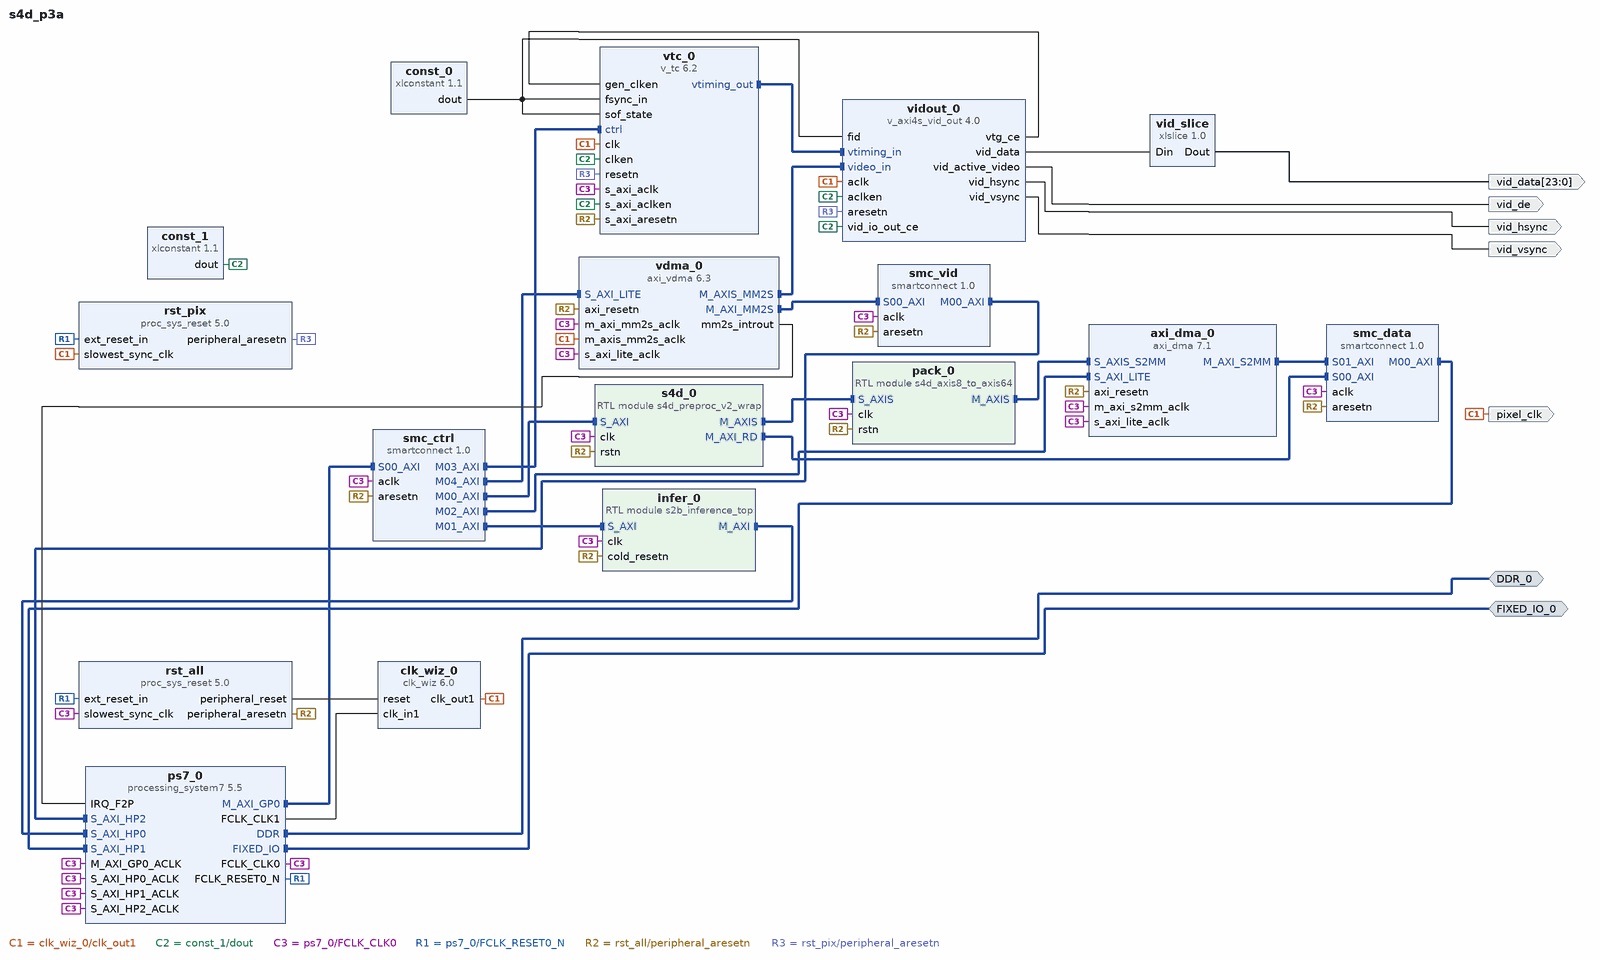
[diagram p0: block diagram of the top level]
# Vivado block design s4d_p3a, xc7z020clg400-2, Vivado 2026.1
create_bd_design s4d_p3a

create_bd_intf_port -mode Master -vlnv xilinx.com:interface:ddrx_rtl:1.0 DDR_0
create_bd_intf_port -mode Master -vlnv xilinx.com:display_processing_system7:fixedio_rtl:1.0 FIXED_IO_0
create_bd_port -dir O -type clk pixel_clk
create_bd_port -dir O vid_hsync
create_bd_port -dir O vid_vsync
create_bd_port -dir O vid_de
create_bd_port -dir O -from 23 -to 0 vid_data

create_bd_cell -type ip -vlnv xilinx.com:ip:processing_system7:5.5 ps7_0
set_property -dict [list \
  CONFIG.PCW_EN_CLK1_PORT 1 \
  CONFIG.PCW_FCLK_CLK1_BUF TRUE \
  CONFIG.PCW_FPGA0_PERIPHERAL_FREQMHZ 50 \
  CONFIG.PCW_FPGA1_PERIPHERAL_FREQMHZ 100 \
  CONFIG.PCW_FPGA_FCLK1_ENABLE 1 \
  CONFIG.PCW_IRQ_F2P_INTR 1 \
  CONFIG.PCW_USE_FABRIC_INTERRUPT 1 \
  CONFIG.PCW_USE_S_AXI_HP0 1 \
  CONFIG.PCW_USE_S_AXI_HP1 1 \
  CONFIG.PCW_USE_S_AXI_HP2 1 \
] [get_bd_cells ps7_0]
# 37 more settings of ps7_0 are not shown: defaults, MIO pin electricals, DDR timing, and values the tool derives
create_bd_cell -type module -reference s4d_preproc_v2_wrap s4d_0
set_property -dict {CONFIG.SRC_BASE 0x12000000} [get_bd_cells s4d_0]
create_bd_cell -type module -reference s2b_inference_top infer_0
set_property -dict {CONFIG.PROFILE_VISIBILITY_PROVEN 1} [get_bd_cells infer_0]
create_bd_cell -type module -reference s4d_axis8_to_axis64 pack_0
create_bd_cell -type ip -vlnv xilinx.com:ip:axi_dma:7.1 axi_dma_0
set_property -dict [list \
  CONFIG.c_addr_width 32 \
  CONFIG.c_include_mm2s 0 \
  CONFIG.c_include_s2mm 1 \
  CONFIG.c_include_sg 0 \
  CONFIG.c_m_axi_s2mm_data_width 64 \
  CONFIG.c_s_axis_s2mm_tdata_width 64 \
  CONFIG.c_sg_length_width 23 \
] [get_bd_cells axi_dma_0]
create_bd_cell -type ip -vlnv xilinx.com:ip:clk_wiz:6.0 clk_wiz_0
set_property -dict [list \
  CONFIG.CLKOUT1_DRIVES BUFG \
  CONFIG.CLKOUT1_REQUESTED_OUT_FREQ 74.25 \
  CONFIG.CLKOUT1_USED true \
  CONFIG.CLKOUT2_DRIVES BUFG \
  CONFIG.CLKOUT2_REQUESTED_OUT_FREQ 371.25 \
  CONFIG.CLKOUT2_USED true \
  CONFIG.MMCM_CLKFBOUT_MULT_F 59.375 \
  CONFIG.MMCM_CLKIN1_PERIOD 10.000 \
  CONFIG.MMCM_CLKOUT0_DIVIDE_F 10.000 \
  CONFIG.MMCM_CLKOUT1_DIVIDE 2 \
  CONFIG.MMCM_DIVCLK_DIVIDE 8 \
  CONFIG.NUM_OUT_CLKS 2 \
  CONFIG.OVERRIDE_MMCM true \
  CONFIG.PRIM_IN_FREQ 100.000 \
  CONFIG.PRIM_SOURCE Single_ended_clock_capable_pin \
  CONFIG.USE_LOCKED true \
  CONFIG.USE_RESET true \
] [get_bd_cells clk_wiz_0]
create_bd_cell -type ip -vlnv xilinx.com:ip:v_tc:6.2 vtc_0
set_property -dict [list \
  CONFIG.GEN_AVIDEO_POLARITY High \
  CONFIG.GEN_HBLANK_POLARITY High \
  CONFIG.GEN_HSYNC_POLARITY High \
  CONFIG.GEN_VBLANK_POLARITY High \
  CONFIG.GEN_VIDEO_FORMAT RGB \
  CONFIG.GEN_VSYNC_POLARITY High \
  CONFIG.HAS_AXI4_LITE true \
  CONFIG.HAS_INTC_IF false \
  CONFIG.VIDEO_MODE 720p \
  CONFIG.enable_detection false \
  CONFIG.enable_generation true \
  CONFIG.max_clocks_per_line 4096 \
  CONFIG.max_lines_per_frame 4096 \
] [get_bd_cells vtc_0]
create_bd_cell -type ip -vlnv xilinx.com:ip:axi_vdma:6.3 vdma_0
set_property -dict [list \
  CONFIG.c_addr_width 32 \
  CONFIG.c_include_mm2s 1 \
  CONFIG.c_include_s2mm 0 \
  CONFIG.c_include_sg 0 \
  CONFIG.c_m_axi_mm2s_data_width 64 \
  CONFIG.c_m_axis_mm2s_tdata_width 32 \
  CONFIG.c_use_fsync 0 \
] [get_bd_cells vdma_0]
create_bd_cell -type ip -vlnv xilinx.com:ip:v_axi4s_vid_out:4.0 vidout_0
set_property -dict [list \
  CONFIG.C_ADDR_WIDTH 10 \
  CONFIG.C_HAS_ASYNC_CLK 0 \
  CONFIG.C_HYSTERESIS_LEVEL 12 \
  CONFIG.C_NATIVE_COMPONENT_WIDTH 8 \
  CONFIG.C_PIXELS_PER_CLOCK 1 \
  CONFIG.C_S_AXIS_VIDEO_DATA_WIDTH 8 \
  CONFIG.C_S_AXIS_VIDEO_FORMAT 6 \
  CONFIG.C_VTG_MASTER_SLAVE 0 \
] [get_bd_cells vidout_0]
create_bd_cell -type ip -vlnv xilinx.com:ip:xlslice:1.0 vid_slice
set_property -dict {CONFIG.DIN_FROM 23 CONFIG.DIN_TO 0 CONFIG.DIN_WIDTH 32 CONFIG.DOUT_WIDTH 24} [get_bd_cells vid_slice]
create_bd_cell -type ip -vlnv xilinx.com:ip:proc_sys_reset:5.0 rst_all
create_bd_cell -type ip -vlnv xilinx.com:ip:proc_sys_reset:5.0 rst_pix
create_bd_cell -type ip -vlnv xilinx.com:ip:xlconstant:1.1 const_1
set_property -dict {CONFIG.CONST_VAL 1 CONFIG.CONST_WIDTH 1} [get_bd_cells const_1]
create_bd_cell -type ip -vlnv xilinx.com:ip:xlconstant:1.1 const_0
set_property -dict {CONFIG.CONST_VAL 0 CONFIG.CONST_WIDTH 1} [get_bd_cells const_0]
create_bd_cell -type ip -vlnv xilinx.com:ip:smartconnect:1.0 smc_ctrl
set_property -dict {CONFIG.NUM_MI 5 CONFIG.NUM_SI 1} [get_bd_cells smc_ctrl]
create_bd_cell -type ip -vlnv xilinx.com:ip:smartconnect:1.0 smc_data
set_property -dict {CONFIG.NUM_MI 1 CONFIG.NUM_SI 2} [get_bd_cells smc_data]
create_bd_cell -type ip -vlnv xilinx.com:ip:smartconnect:1.0 smc_vid
set_property -dict {CONFIG.NUM_MI 1 CONFIG.NUM_SI 1} [get_bd_cells smc_vid]

# ---- connections ----

connect_bd_intf_net [get_bd_intf_pins axi_dma_0/M_AXI_S2MM] [get_bd_intf_pins smc_data/S01_AXI]
connect_bd_intf_net [get_bd_intf_pins infer_0/M_AXI] [get_bd_intf_pins ps7_0/S_AXI_HP0]
connect_bd_intf_net [get_bd_intf_pins pack_0/M_AXIS] [get_bd_intf_pins axi_dma_0/S_AXIS_S2MM]
connect_bd_intf_net [get_bd_intf_ports DDR_0] [get_bd_intf_pins ps7_0/DDR]
connect_bd_intf_net [get_bd_intf_ports FIXED_IO_0] [get_bd_intf_pins ps7_0/FIXED_IO]
connect_bd_intf_net [get_bd_intf_pins ps7_0/M_AXI_GP0] [get_bd_intf_pins smc_ctrl/S00_AXI]
connect_bd_intf_net [get_bd_intf_pins s4d_0/M_AXIS] [get_bd_intf_pins pack_0/S_AXIS]
connect_bd_intf_net [get_bd_intf_pins s4d_0/M_AXI_RD] [get_bd_intf_pins smc_data/S00_AXI]
connect_bd_intf_net [get_bd_intf_pins smc_ctrl/M00_AXI] [get_bd_intf_pins s4d_0/S_AXI]
connect_bd_intf_net [get_bd_intf_pins smc_ctrl/M01_AXI] [get_bd_intf_pins infer_0/S_AXI]
connect_bd_intf_net [get_bd_intf_pins smc_ctrl/M02_AXI] [get_bd_intf_pins axi_dma_0/S_AXI_LITE]
connect_bd_intf_net [get_bd_intf_pins smc_ctrl/M03_AXI] [get_bd_intf_pins vtc_0/ctrl]
connect_bd_intf_net [get_bd_intf_pins smc_ctrl/M04_AXI] [get_bd_intf_pins vdma_0/S_AXI_LITE]
connect_bd_intf_net [get_bd_intf_pins smc_data/M00_AXI] [get_bd_intf_pins ps7_0/S_AXI_HP1]
connect_bd_intf_net [get_bd_intf_pins smc_vid/M00_AXI] [get_bd_intf_pins ps7_0/S_AXI_HP2]
connect_bd_intf_net [get_bd_intf_pins vdma_0/M_AXIS_MM2S] [get_bd_intf_pins vidout_0/video_in]
connect_bd_intf_net [get_bd_intf_pins vdma_0/M_AXI_MM2S] [get_bd_intf_pins smc_vid/S00_AXI]
connect_bd_intf_net [get_bd_intf_pins vtc_0/vtiming_out] [get_bd_intf_pins vidout_0/vtiming_in]
connect_bd_net [get_bd_pins clk_wiz_0/clk_out1] \
  [get_bd_pins rst_pix/slowest_sync_clk] [get_bd_pins vtc_0/clk] [get_bd_pins vidout_0/aclk] \
  [get_bd_pins vdma_0/m_axis_mm2s_aclk] [get_bd_ports pixel_clk]
connect_bd_net [get_bd_pins const_0/dout] [get_bd_pins vtc_0/fsync_in] [get_bd_pins vtc_0/sof_state] [get_bd_pins vidout_0/fid]
connect_bd_net [get_bd_pins const_1/dout] \
  [get_bd_pins vtc_0/clken] [get_bd_pins vtc_0/s_axi_aclken] [get_bd_pins vidout_0/aclken] \
  [get_bd_pins vidout_0/vid_io_out_ce]
connect_bd_net [get_bd_pins ps7_0/FCLK_CLK0] \
  [get_bd_pins rst_all/slowest_sync_clk] [get_bd_pins axi_dma_0/m_axi_s2mm_aclk] [get_bd_pins axi_dma_0/s_axi_lite_aclk] \
  [get_bd_pins ps7_0/M_AXI_GP0_ACLK] [get_bd_pins ps7_0/S_AXI_HP0_ACLK] [get_bd_pins ps7_0/S_AXI_HP1_ACLK] \
  [get_bd_pins ps7_0/S_AXI_HP2_ACLK] [get_bd_pins s4d_0/clk] [get_bd_pins infer_0/clk] [get_bd_pins pack_0/clk] \
  [get_bd_pins vtc_0/s_axi_aclk] [get_bd_pins vdma_0/s_axi_lite_aclk] [get_bd_pins vdma_0/m_axi_mm2s_aclk] \
  [get_bd_pins smc_ctrl/aclk] [get_bd_pins smc_data/aclk] [get_bd_pins smc_vid/aclk]
connect_bd_net [get_bd_pins ps7_0/FCLK_CLK1] [get_bd_pins clk_wiz_0/clk_in1]
connect_bd_net [get_bd_pins ps7_0/FCLK_RESET0_N] [get_bd_pins rst_all/ext_reset_in] [get_bd_pins rst_pix/ext_reset_in]
connect_bd_net [get_bd_pins rst_all/peripheral_aresetn] \
  [get_bd_pins s4d_0/rstn] [get_bd_pins infer_0/cold_resetn] [get_bd_pins pack_0/rstn] [get_bd_pins smc_ctrl/aresetn] \
  [get_bd_pins smc_data/aresetn] [get_bd_pins smc_vid/aresetn] [get_bd_pins axi_dma_0/axi_resetn] \
  [get_bd_pins vtc_0/s_axi_aresetn] [get_bd_pins vdma_0/axi_resetn]
connect_bd_net [get_bd_pins rst_all/peripheral_reset] [get_bd_pins clk_wiz_0/reset]
connect_bd_net [get_bd_pins rst_pix/peripheral_aresetn] [get_bd_pins vtc_0/resetn] [get_bd_pins vidout_0/aresetn]
connect_bd_net [get_bd_pins vdma_0/mm2s_introut] [get_bd_pins ps7_0/IRQ_F2P]
connect_bd_net [get_bd_pins vid_slice/Dout] [get_bd_ports vid_data]
connect_bd_net [get_bd_pins vidout_0/vid_active_video] [get_bd_ports vid_de]
connect_bd_net [get_bd_pins vidout_0/vid_data] [get_bd_pins vid_slice/Din]
connect_bd_net [get_bd_pins vidout_0/vid_hsync] [get_bd_ports vid_hsync]
connect_bd_net [get_bd_pins vidout_0/vid_vsync] [get_bd_ports vid_vsync]
connect_bd_net [get_bd_pins vidout_0/vtg_ce] [get_bd_pins vtc_0/gen_clken]

# ---- address map ----
assign_bd_address -offset 0x00000000 -range 1G -target_address_space [get_bd_addr_spaces axi_dma_0/Data_S2MM] [get_bd_addr_segs ps7_0/S_AXI_HP1/HP1_DDR_LOWOCM]
assign_bd_address -offset 0x00000000 -range 1G -target_address_space [get_bd_addr_spaces infer_0/M_AXI] [get_bd_addr_segs ps7_0/S_AXI_HP0/HP0_DDR_LOWOCM]
assign_bd_address -offset 0x43C00000 -range 64K -target_address_space [get_bd_addr_spaces ps7_0/Data] [get_bd_addr_segs infer_0/S_AXI/reg0]
assign_bd_address -offset 0x43C10000 -range 128 -target_address_space [get_bd_addr_spaces ps7_0/Data] [get_bd_addr_segs s4d_0/S_AXI/reg0]
assign_bd_address -offset 0x43C20000 -range 64K -target_address_space [get_bd_addr_spaces ps7_0/Data] [get_bd_addr_segs axi_dma_0/S_AXI_LITE/Reg]
assign_bd_address -offset 0x43C30000 -range 64K -target_address_space [get_bd_addr_spaces ps7_0/Data] [get_bd_addr_segs vtc_0/ctrl/Reg]
assign_bd_address -offset 0x43C40000 -range 64K -target_address_space [get_bd_addr_spaces ps7_0/Data] [get_bd_addr_segs vdma_0/S_AXI_LITE/Reg]
assign_bd_address -offset 0x00000000 -range 1G -target_address_space [get_bd_addr_spaces s4d_0/M_AXI_RD] [get_bd_addr_segs ps7_0/S_AXI_HP1/HP1_DDR_LOWOCM]
assign_bd_address -offset 0x00000000 -range 1G -target_address_space [get_bd_addr_spaces vdma_0/Data_MM2S] [get_bd_addr_segs ps7_0/S_AXI_HP2/HP2_DDR_LOWOCM]

validate_bd_design
save_bd_design
